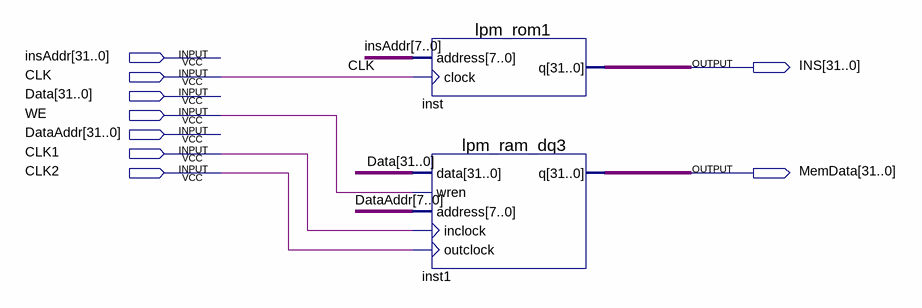
[diagram p0: schematic sheet]
// Quartus schematic storage_temp.bdf as structural Verilog: 2 symbols, 9 pins
module storage_temp (
  input  [31:0] insAddr,
  input  CLK,
  input  [31:0] Data,
  input  WE,
  input  [31:0] DataAddr,
  input  CLK1,
  input  CLK2,
  output [31:0] INS,
  output [31:0] MemData
);

  lpm_rom1 inst (.address(insAddr[7:0]), .clock(CLK), .q(INS));
  lpm_ram_dq3 inst1 (.data(Data), .wren(WE), .address(DataAddr[7:0]), .inclock(CLK1), .outclock(CLK2), .q(MemData));
endmodule
